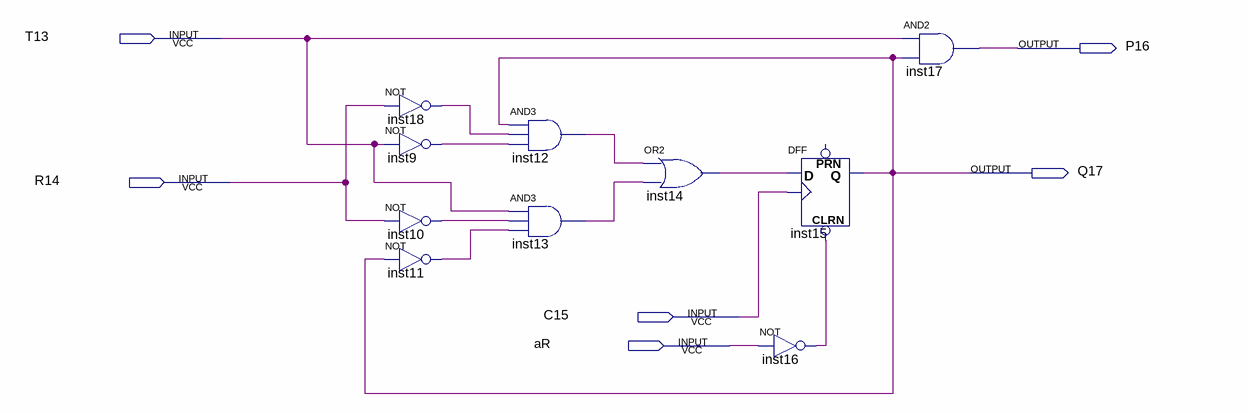
[diagram p0: schematic sheet]
// Quartus schematic ReceicCTEB.bdf as structural Verilog: 10 symbols, 6 pins
module ReceicCTEB (
  input  T13,
  input  R14,
  input  C15,
  input  aR,
  output P16,
  output Q17
);

  wire inst9_out, inst10_out, inst11_out, inst12_out, inst13_out, inst14_out, inst16_out, inst18_out;

  not inst18 (inst18_out, R14);
  not inst9 (inst9_out, T13);
  not inst10 (inst10_out, R14);
  not inst11 (inst11_out, Q17);
  and inst12 (inst12_out, Q17, inst18_out, inst9_out);
  and inst13 (inst13_out, T13, inst10_out, inst11_out);
  or inst14 (inst14_out, inst12_out, inst13_out);
  not inst16 (inst16_out, aR);
  DFF inst15 (.CLRN(inst16_out), .CLK(C15), .D(inst14_out), .Q(Q17));  // open: PRN
  and inst17 (P16, T13, Q17);
endmodule
